# Altium project PGS-System.PrjPcb (part 10 of 16)

## Sheet RV1126_SDMMC_SHEET.SchDoc
size A4; SheetNumber: 16; SheetTotal: 26
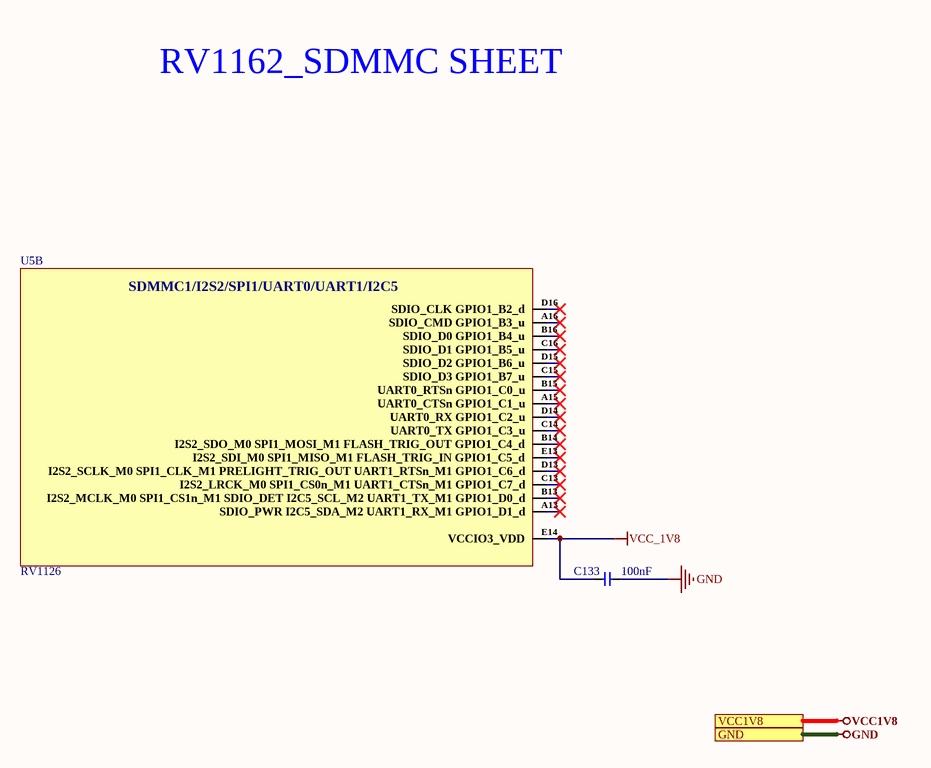
[diagram p16: RV1126_SDMMC_SHEET.SchDoc]

### Parts
C133  100nF  [Cap-0402]
U5  RV1126  [FCCSP-409(14x14)]  (part B of 15)

### Ports
GND (see BUCK_CONTROLLER_SHEET[3D], DDR3_SDRAM_SHEET[5D], DEBUG_UART_INTERFACE[3D], DIGITAL_MEMS_INTERFACE[3C], eMMC_INTERFACE[3D], ETH_PoE-PD_INTERFACE[4D], ETH_SWITCH_INTERFACE[5D], IR-CUT_LIGHT SENSOR_SHEET[3D], MIPI TO HDMI_MODULE[3D], MIPI-CSI_RXX_INTERFACE[3C], PoE_PSE_CONTROLLER[5D], POWER_LDO_SHEET[3D], POWER_PMIC_RK809_CODEC[3C], POWER_PMIC_RK809_DC DC[3D], POWER_PMIC_RK809_LDO[4C], POWER_PMIC_RK809_MGM[3D], RV1126_AUDIO_SHEET[3D], RV1126_DRAM_SHEET[4C], RV1126_eMMC_SPI-FLASH[3C], RV1126_ETHERNET_SHEET[3D], RV1126_OSC-PLL-PMUIO[3C], RV1126_POWER_SHEET[1D], RV1126_SARADC_SHEET[3C], SPEARKER_INTERFACE_SHEET[3C], SPI_FLASH_INTERFACE[3D], USB2.0_DEBUG_UART[3D]), VCC1V8 (see DIGITAL_MEMS_INTERFACE[3C], IR-CUT_LIGHT SENSOR_SHEET[3D], MIPI TO HDMI_MODULE[3D], MIPI-CSI_RXX_INTERFACE[3C], POWER_PMIC_RK809_LDO[4C], POWER_PMIC_RK809_MGM[3D], RV1126_AUDIO_SHEET[3D], RV1126_eMMC_SPI-FLASH[3C], RV1126_ETHERNET_SHEET[3D], RV1126_OSC-PLL-PMUIO[3C], RV1126_SARADC_SHEET[3C], USB2.0_DEBUG_UART[3D])

### Nets
GND: C133.1 ; port GND  [project net KSENSD]
VCC_1V8: C133.2 U5.E14(VCCIO3_VDD)

Not connected (* = marked no-connect by the designer): U5 A13(SDIO_PWR_I2C5_SDA_M2_UART1_RX_M1_GPIO1_D1_d)* A15(UART0_CTSn_GPIO1_C1_u)* A16(SDIO_CMD_GPIO1_B3_u)* B13(I2S2_MCLK_M0_SPI1_CS1n_M1_SDIO_DET_I2C5_SCL_M2_UART1_TX_M1_GPIO1_D0_d)* B14(I2S2_SDO_M0_SPI1_MOSI_M1_FLASH_TRIG_OUT_GPIO1_C4_d)* B15(UART0_RTSn_GPIO1_C0_u)* B16(SDIO_D0_GPIO1_B4_u)* C13(I2S2_LRCK_M0_SPI1_CS0n_M1_UART1_CTSn_M1_GPIO1_C7_d)* C14(UART0_TX_GPIO1_C3_u)* C15(SDIO_D3_GPIO1_B7_u)* C16(SDIO_D1_GPIO1_B5_u)* D13(I2S2_SCLK_M0_SPI1_CLK_M1_PRELIGHT_TRIG_OUT_UART1_RTSn_M1_GPIO1_C6_d)* D14(UART0_RX_GPIO1_C2_u)* D15(SDIO_D2_GPIO1_B6_u)* D16(SDIO_CLK_GPIO1_B2_d)* E13(I2S2_SDI_M0_SPI1_MISO_M1_FLASH_TRIG_IN_GPIO1_C5_d)*

### Notes on the sheet
- RV1162_SDMMC SHEET
- File:
- Title:
- Date:
- Page
- Num:
- Total:
- Drawn By: Huzaifa Ali
- (in symbol RV1126, part B) SDMMC1/I2S2/SPI1/UART0/UART1/I2C5

### Library data of the parts
C133 = CC0402KRX5R7BB104: CAP CER 0.1UF 16V X5R 0402; Manufacturer: Yageo; Tolerance: 10%; Supplier 1: Mouser; Manufacturer Part Number: CC0402KRX5R7BB104; RoHS: Yes; Category: Ceramic Capacitors; Stock 1: 936792; Pricing 1: 1=0.10000, 10=0.02300, 50=0.02300, 100=0.01100, 1000=0.00600, 10000=0.00400 (USD); Mount: Surface Mount; Case/Package: 0402; Case Code (Imperial): 0402; Case Code (Metric): 1005; Min Operating Temperature: -55°C; Max Operating Temperature: 85°C; Capacitance: 100nF; Packaging: Tape and Reel; Voltage Rating: 16V; Dielectric: X5R; Termination: SMD/SMT; Voltage Rating (DC): 16V; Package Quantity: 1; Length: 1mm; Width: 0.02inch; Thickness: 0.022inch; Lead Free: Lead Free; Halogen Free: Halogen Free; ComponentLink1URL: https://datasheet.ciiva.com/155/mlccorderingcode-155879.pdf?src-supplier=Digi-Key; ComponentLink1Description: https://datasheet.ciiva.com/155/mlccorderingcode-155879.pdf?src-supplier=Digi-Key; ComponentLink2URL: https://datasheet.ciiva.com/155/mlccorderingcode-155878.pdf?src-supplier=Digi-Key; ComponentLink2Description: https://datasheet.ciiva.com/155/mlccorderingcode-155878.pdf?src-supplier=Digi-Key; ComponentLink3URL: https://datasheet.ciiva.com/155/mlccorderingcode-155880.pdf?src-supplier=Digi-Key; ComponentLink3Description: https://datasheet.ciiva.com/155/mlccorderingcode-155880.pdf?src-supplier=Digi-Key; Supplier Part Number 1: 603-CC402KRX5R7BB104; LCSC Part Number: C106204; Number of Pins: 2; Resistor Type: Ceramic; Series: CC; Construction: Flat; Height: 0.5mm; Depth: 0.5mm; Radiation Hardening: No; REACH SVHC: Unknown; RoHS Compliant: Yes; ComponentLink4URL: https://datasheet.ciiva.com/11464/upy-gphc-x5r-4v-to-50v-12-11464869.pdf?src-supplier=Avnet; ComponentLink4Description: https://datasheet.ciiva.com/11464/upy-gphc-x5r-4v-to-50v-12-11464869.pdf?src-supplier=Avnet
U5 = RV1126: as U5 on sheet RV1126_POWER_SHEET; Manufacturer Part Number: RV1126; Package: FCCSP-409(14x14); LCSC Part Number: C2859017; Item Type: Microcontroller; ComponentLink1Description: LCSC; ComponentLink1URL: https://www.lcsc.com/product-detail/Microcontroller-Units-MCUs-MPUs-SOCs_Rockchip-RV1126_C2859017.html